# Altium schematic sheet TYPE-C.SchDoc
size A4; SheetNumber: 7; SheetTotal: 13
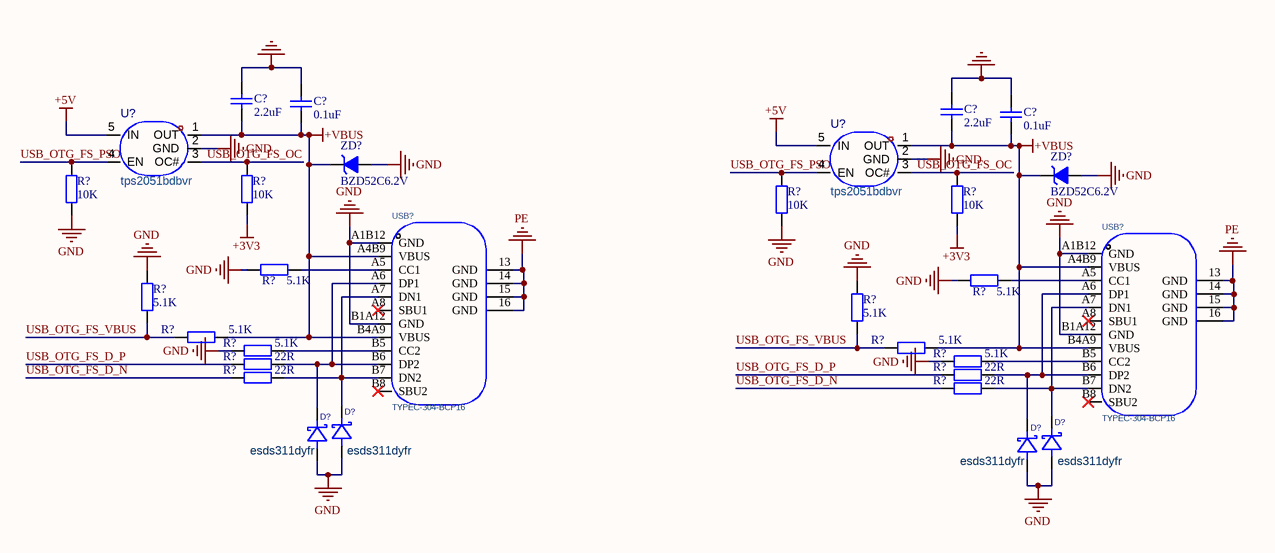
[diagram p0: TYPE-C.SchDoc]

## Parts
(Parts that share a designator on the sheet are numbered #1, #2 ... from top to bottom, then left to right.)
C?#1  2.2uF  [C0603]
C?#2  0.1uF  [C0603]
C?#3  2.2uF  [C0603]
C?#4  0.1uF  [C0603]
D?#1  esds311dyfr  [SOD-323_L1.7-W1.3-LS2.6-RD-1]
D?#2  esds311dyfr  [SOD-323_L1.7-W1.3-LS2.6-RD-1]
D?#3  esds311dyfr  [SOD-323_L1.7-W1.3-LS2.6-RD-1]
D?#4  esds311dyfr  [SOD-323_L1.7-W1.3-LS2.6-RD-1]
R?#1  10K  [R0603]
R?#2  10K  [R0603]
R?#3  10K  [R0603]
R?#4  10K  [R0603]
R?#5  5.1K  [R0603]
R?#6  5.1K  [R0603]
R?#7  5.1K  [R0603]
R?#8  5.1K  [R0603]
R?#9  5.1K  [R0603]
R?#10  5.1K  [R0603]
R?#11  5.1K  [R0603]
R?#12  22R  [R0603]
R?#13  5.1K  [R0603]
R?#14  22R  [R0603]
R?#15  22R  [R0603]
R?#16  22R  [R0603]
U?#1  tps2051bdbvr  [SOT-23-5_L3.0-W1.7-P0.95-LS2.8-BR]
U?#2  tps2051bdbvr  [SOT-23-5_L3.0-W1.7-P0.95-LS2.8-BR]
USB?#1  TYPEC-304-BCP16  [USB-C-SMD_TYPEC-304-BCP16]
USB?#2  TYPEC-304-BCP16  [USB-C-SMD_TYPEC-304-BCP16]
ZD?#1  BZD52C6.2V  [SOD-123_L2.7-W1.6-LS3.7-RD]
ZD?#2  BZD52C6.2V  [SOD-123_L2.7-W1.6-LS3.7-RD]

## Nets
+3V3: R?#3.1 R?#4.1
+5V: U?#1.5(IN) U?#2.5(IN)
+VBUS: C?#1.2 C?#2.2 C?#3.2 C?#4.2 R?#9.2 R?#10.2 U?#1.1(OUT) U?#2.1(OUT) USB?#1.A4B9(VBUS) USB?#1.B4A9(VBUS) USB?#2.A4B9(VBUS) USB?#2.B4A9(VBUS) ZD?#1.1 ZD?#2.1
GND: D?#1.2(A) D?#2.2(A) D?#3.2(A) D?#4.2(A) R?#1.2 R?#2.2 R?#5.1 R?#6.2 R?#7.1 R?#8.2 R?#11.2 R?#13.2 U?#1.2(GND) U?#2.2(GND) USB?#1.A1B12(GND) USB?#1.B1A12(GND) USB?#2.A1B12(GND) USB?#2.B1A12(GND) ZD?#1.2 ZD?#2.2
NetC?#1_1: C?#1.1 C?#2.1 C?#3.1 C?#4.1
PE: USB?#1.13(GND) USB?#1.14(GND) USB?#1.15(GND) USB?#1.16(GND) USB?#2.13(GND) USB?#2.14(GND) USB?#2.15(GND) USB?#2.16(GND)
USB_OTG_FS_D_N: R?#14.2 R?#16.2
USB_OTG_FS_D_P: R?#12.2 R?#15.2
USB_OTG_FS_OC: R?#3.2 R?#4.2 U?#1.3(OC#) U?#2.3(OC#)
USB_OTG_FS_PSO: R?#1.1 R?#2.1 U?#1.4(EN) U?#2.4(EN)
USB_OTG_FS_VBUS: R?#5.2 R?#7.2 R?#9.1 R?#10.1
NetD?#1_1: D?#1.1(K) R?#14.1 USB?#1.A7(DN1) USB?#1.B7(DN2)
NetD?#2_1: D?#2.1(K) R?#12.1 USB?#1.A6(DP1) USB?#1.B6(DP2)
NetD?#3_1: D?#3.1(K) R?#15.1 USB?#2.A6(DP1) USB?#2.B6(DP2)
NetD?#4_1: D?#4.1(K) R?#16.1 USB?#2.A7(DN1) USB?#2.B7(DN2)
NetR?#6_1: R?#6.1 USB?#1.A5(CC1)
NetR?#8_1: R?#8.1 USB?#2.A5(CC1)
NetR?#11_1: R?#11.1 USB?#1.B5(CC2)
NetR?#13_1: R?#13.1 USB?#2.B5(CC2)

Not connected (* = marked no-connect by the designer): USB?#1 A8(SBU1)* B8(SBU2)*; USB?#2 A8(SBU1)* B8(SBU2)*

## Library data of the parts
C?#1-C?#4 = C0603: Capacitor; Value: 104; Published: 8-Jun-2000; LatestRevisionDate: 17-Jul-2002; LatestRevisionNote: Re-released for DXP Platform.; Publisher: Altium Limited
D?#1-D?#4 = esds311dyfr: 极性:单向;反向截止电压(Vrwm):3.6V;钳位电压:7.7V;峰值脉冲电流(Ipp):25A@8/20us;峰值脉冲功率(Ppp):170W@8/20us;击穿电压(VBR):7.5V;; Manufacturer: TI(德州仪器); AddInBom: yes; ModelId: eba151483b2844ffacda3a6d97308fa1; ModelTransform: 100.394,49.2125,0,0,0,0,0,0,0; Polarity: 单向; Reverse Stand-Off Voltage (Vrwm): 3.6V; Clamping Voltage: 7.7V; Voltage - Breakdown: 7.5V; Reverse Leakage Current (Ir): 5nA; Number of Channels: 单路; level of protection: IEC 61000-4-4；IEC 61000-4-5；IEC 61000-4-2; Type: TVS; Junction Capacitance: 4.5pF; LCSC Part Name: 单向TVS 3.6V截止 峰值浪涌电流：25A@8/20us; SupplierPart: C30938562; ManufacturerPart: ESDS311DYFR; Supplier Footprint: SOD-323; JLCPCB Part Class: Extended Part; Datasheet: https://www.ti.com.cn/cn/lit/ds/symlink/esds311.pdf?ts=1736913524660&ref_url=https%253A%252F%252Fwww.ti.com.cn%252Fsitesearch%252Fzh-cn%252Fdocs%252Funiversalsearch.tsp%253FlangPref%253Dzh-CN%2526nr%253D9%2526searchTerm%253DESDS311DYFR; Supplier: LCSC; ConvertToPcb: yes; SymbolName: ESDS311DYFR; FootprintName: SOD-323_L1.7-W1.3-LS2.6-RD-1; ModelName: SOD-323_L1.7-W1.3-LS2.6-RD-1; Peak Pulse Current (Ipp): 25A@8/20us; Peak Pulse Power Dissipation (Ppp): 170W@8/20us; Operating Temperature: -40℃~+125℃
R?#1-R?#16 = R0603: RES 5.1K OHM 1/10W 1% 0603 SMD; Published: 8-Jun-2000; LatestRevisionDate: 17-Jul-2002; LatestRevisionNote: Re-released for DXP Platform.; Publisher: Altium Limited
U?#1 U?#2 = tps2051bdbvr: 类型:高侧开关;通道数:1;输入控制逻辑:高电平有效;工作电压:2.7V~5.5V;最大连续电流:500mA;导通电阻:95mΩ;; Manufacturer: TI(德州仪器); AddInBom: yes; ModelId: 0a2a1b8f50944f73965918ad6e5fe167; ModelName: SOT-23-5_L2.9-W1.6-H1.1-LS2.8-P0.95; ModelTransform: 114.173,109.636,0,180,0,0,0,0,0; Number of Channels: 1; Control Input Logic: 高电平有效; Maximum Continuous Current: 500mA; RDS(on): 95mΩ; Symbol: TPS2051BDBVR; LCSC Part Name: 电流限制型功率分配开关; SupplierPart: C24593; ManufacturerPart: TPS2051BDBVR; Supplier Footprint: SOT-23-5; JLCPCB Part Class: Extended Part; Datasheet: https://www.ti.com/cn/lit/ds/symlink/tps2051b.pdf; Supplier: LCSC; ConvertToPcb: yes; FootprintName: SOT-23-5_L3.0-W1.7-P0.95-LS2.8-BR; Type: 高侧开关; Voltage - Supply: 2.7V~5.5V; Features: 短路保护；过流保护；过温保护；集成电荷泵；反向电流阻断；欠压锁定; Operating Temperature	-: -40℃~+85℃
USB?#1 USB?#2 = TYPEC-304-BCP16_C720629: Manufacturer: XUNPU(讯普); Add into BOM: yes; Connector Type: Type-C; Protocol Standard: USB 3.1; Gender: 母; Number of Contacts: 16P; Number of Ports: 1; Current Rating-Power: 3A; Symbol: TYPEC-304-BCP16; Device: TYPEC-304-BCP16_C720629; LCSC Part Name: 停产 Type-C 母 卧贴; Supplier Part: C720629; Manufacturer Part: TYPEC-304-BCP16; Supplier Footprint: SMD; JLCPCB Part Class: Extended Part; Datasheet: https://atta.szlcsc.com/upload/public/pdf/source/20220210/1FE0FEFF7D6A20C111212527D3DED014.pdf; Supplier: LCSC; Convert to PCB: yes; Mounting Type: 卧贴; Operating Temperature: -25℃~+85℃
ZD?#1 ZD?#2 = DIO_ZENER_6: 9V稳压管; Brand: 10V; Part Number: *